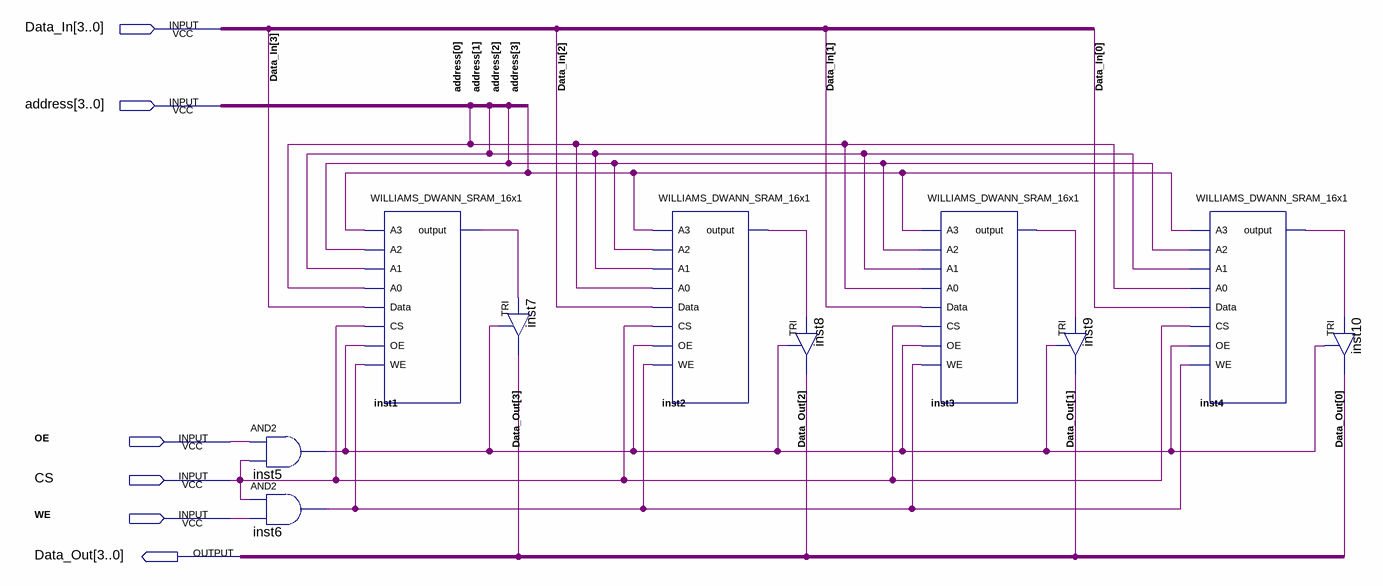
[diagram p0: schematic sheet]
// Quartus schematic WILLIAMS_DWANN_SRAM_16x4.bdf as structural Verilog: 10 symbols, 6 pins
module WILLIAMS_DWANN_SRAM_16x4 (
  input  [3:0] Data_In,
  input  [3:0] address,
  input  OE,
  input  CS,
  input  WE,
  output [3:0] Data_Out
);

  wire inst1_output, inst2_output, inst3_output, inst4_output, inst5_out, inst6_out;

  and inst5 (inst5_out, OE, CS);
  and inst6 (inst6_out, CS, WE);
  WILLIAMS_DWANN_SRAM_16x1 inst1 (
    .A0(address[0]), .A1(address[1]), .Data(Data_In[3]), .WE(inst6_out), .CS(CS), .OE(inst5_out),
    .A2(address[2]), .A3(address[3]), .\output (inst1_output));
  TRI inst7 (.IN(inst1_output), .OE(inst5_out), .OUT(Data_Out[3]));
  WILLIAMS_DWANN_SRAM_16x1 inst2 (
    .A0(address[0]), .A1(address[1]), .Data(Data_In[2]), .WE(inst6_out), .CS(CS), .OE(inst5_out),
    .A2(address[2]), .A3(address[3]), .\output (inst2_output));
  TRI inst8 (.IN(inst2_output), .OE(inst5_out), .OUT(Data_Out[2]));
  WILLIAMS_DWANN_SRAM_16x1 inst3 (
    .A0(address[0]), .A1(address[1]), .Data(Data_In[1]), .WE(inst6_out), .CS(CS), .OE(inst5_out),
    .A2(address[2]), .A3(address[3]), .\output (inst3_output));
  TRI inst9 (.IN(inst3_output), .OE(inst5_out), .OUT(Data_Out[1]));
  WILLIAMS_DWANN_SRAM_16x1 inst4 (
    .A0(address[0]), .A1(address[1]), .Data(Data_In[0]), .WE(inst6_out), .CS(CS), .OE(inst5_out),
    .A2(address[2]), .A3(address[3]), .\output (inst4_output));
  TRI inst10 (.IN(inst4_output), .OE(inst5_out), .OUT(Data_Out[0]));
endmodule
